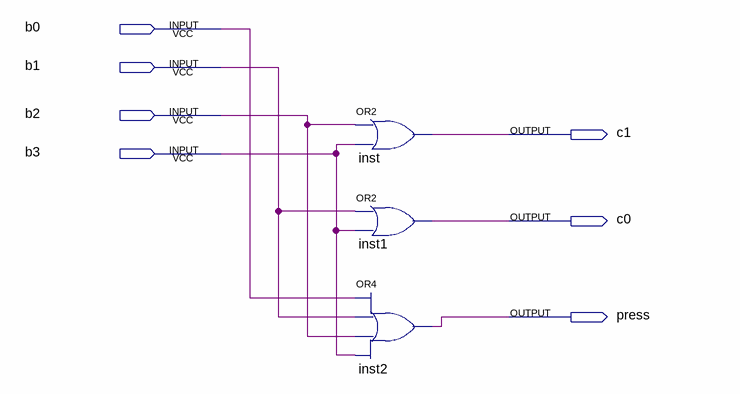
[diagram p0: schematic sheet]
// Quartus schematic codificador.bdf as structural Verilog: 3 symbols, 7 pins
module codificador (
  input  b0,
  input  b1,
  input  b2,
  input  b3,
  output c1,
  output c0,
  output press
);

  or inst (c1, b2, b3);
  or inst1 (c0, b1, b3);
  or inst2 (press, b0, b1, b2, b3);
endmodule
